# Altium schematic sheet Peripherals.SchDoc
size A4; SheetNumber: 5; SheetTotal: 7
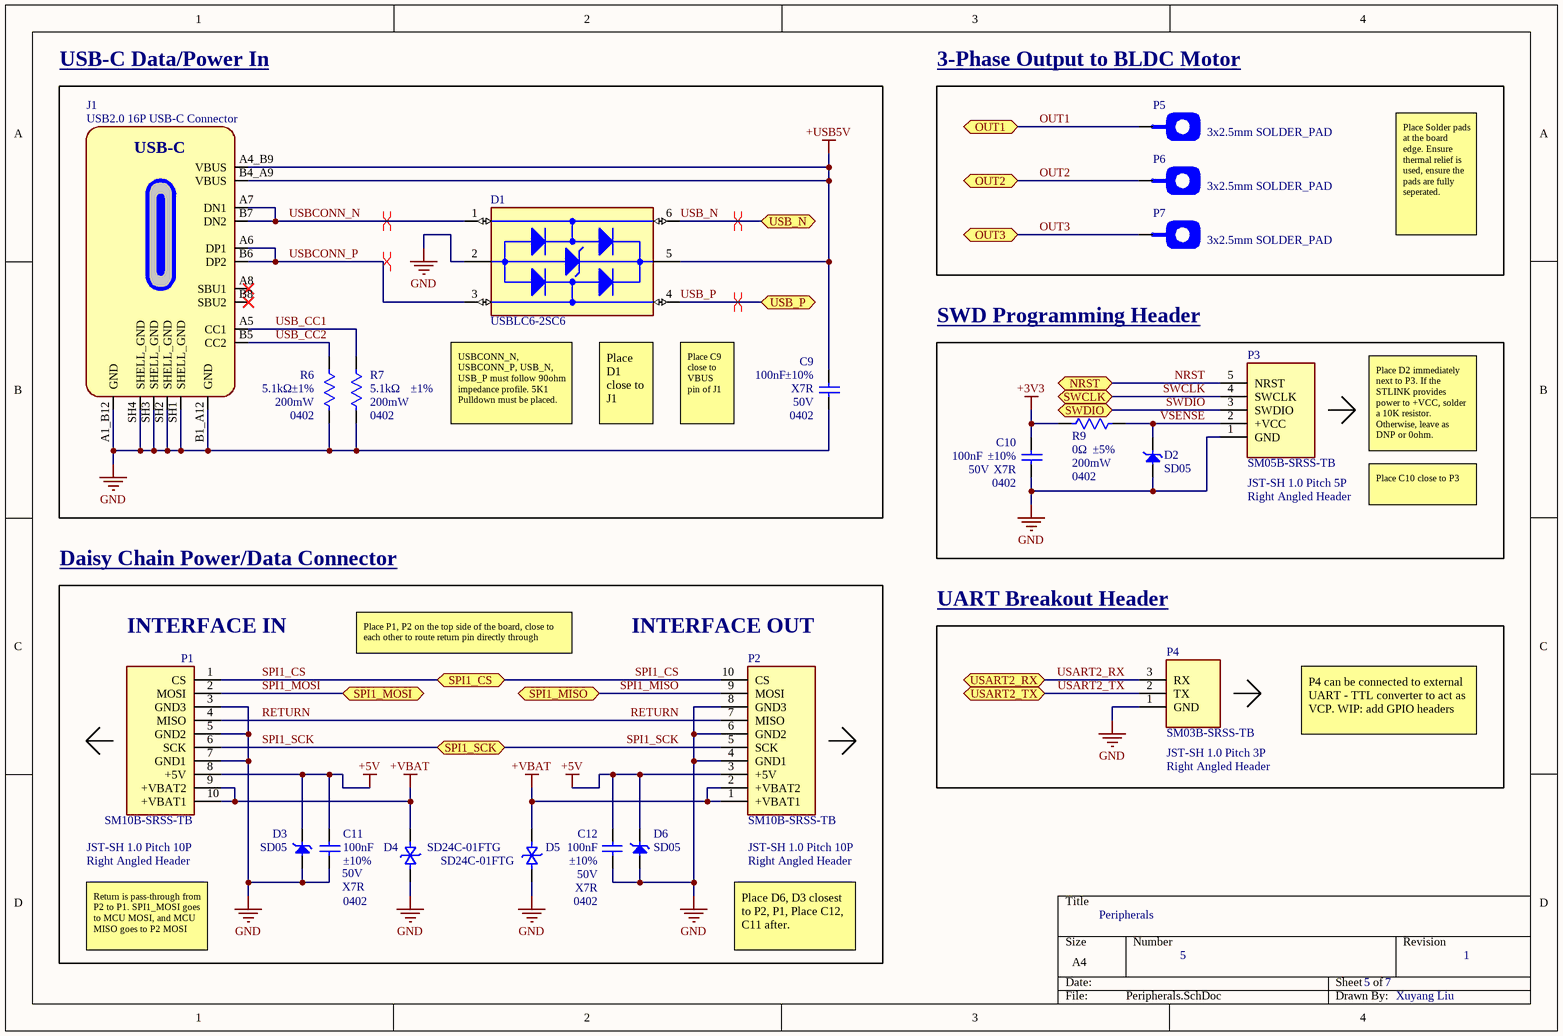
[diagram p0: Peripherals.SchDoc]

## Parts
C9  Case/Package: 0402  Voltage Rating: 50V  Dielectric: X7R  Tolerance: ±10%  [0402_Cap]  (hidden comment: 100nF)
C10  Case/Package: 0402  Voltage Rating: 50V  Dielectric: X7R  Tolerance: ±10%  [0402_Cap]  (hidden comment: 100nF)
C11  Case/Package: 0402  Voltage Rating: 50V  Dielectric: X7R  Tolerance: ±10%  [0402_Cap]  (hidden comment: 100nF)
C12  Case/Package: 0402  Voltage Rating: 50V  Dielectric: X7R  Tolerance: ±10%  [0402_Cap]  (hidden comment: 100nF)
D1  USBLC6-2SC6  [SOT95P280X145-6N]
D2  SD05  [DIO_MM3Z3V0T1G]
D3  SD05  [DIO_MM3Z3V0T1G]
D4  SD24C-01FTG  [FP-SD-C-MFG]
D5  SD24C-01FTG  [FP-SD-C-MFG]
D6  SD05  [DIO_MM3Z3V0T1G]
J1  USB2.0 16P USB-C Connector  [USBC_GCT_USB4105-GF-A-060]
P1  SM10B-SRSS-TB  [SM10B-SRSS-TB]
P2  SM10B-SRSS-TB  [SM10B-SRSS-TB]
P3  SM05B-SRSS-TB  [SM05B-SRSS-TB]
P4  SM03B-SRSS-TB  [SM03B-SRSS-TB]
P5  3x2.5mm SOLDER_PAD  [SOLDER_PAD]
P6  3x2.5mm SOLDER_PAD  [SOLDER_PAD]
P7  3x2.5mm SOLDER_PAD  [SOLDER_PAD]
R6  Tolerance: ±1%  Power Rating: 200mW  Case/Package: 0402  Resistance: 5.1kΩ  [0402_RES]  (hidden comment: 5K1)
R7  Tolerance: ±1%  Power Rating: 200mW  Case/Package: 0402  Resistance: 5.1kΩ  [0402_RES]  (hidden comment: 5K1)
R9  Tolerance: ±5%  Power Rating: 200mW  Case/Package: 0402  Resistance: 0Ω  [0402_RES]  (hidden comment: 0R)

## Blocks framed on the sheet
USB-C Data/Power In: C9 D1 J1 R6 R7
3-Phase Output to BLDC Motor: P5-P7
SWD Programming Header: C10 D2 P3 R9
UART Breakout Header: P4

## Ports
NRST (bidir), OUT1 (bidir), OUT2 (bidir), OUT3 (bidir), SPI1_CS (bidir), SPI1_MISO (bidir), SPI1_MOSI (bidir), SPI1_SCK (bidir), SWCLK (bidir), SWDIO (bidir), USART2_RX (bidir), USART2_TX (bidir), USB_N (bidir), USB_P (bidir)

## Nets
+3V3: C10.2 R9.1
+5V: C11.2 C12.1 D3.K D6.K P1.8(+5V) P2.3(+5V)
+USB5V: C9.2 D1.5(VBUS) J1.A4_B9(VBUS) J1.B4_A9(VBUS)
+VBAT: D4.2 D5.2 P1.9(+VBAT2) P1.10(+VBAT1) P2.1(+VBAT1) P2.2(+VBAT2)
GND: C9.1 C10.1 C11.1 C12.2 D1.2(GND) D2.A D3.A D4.1 D5.1 D6.A J1.A1_B12(GND) J1.B1_A12(GND) J1.SH1(SHELL_GND) J1.SH2(SHELL_GND) J1.SH3(SHELL_GND) J1.SH4(SHELL_GND) P1.3(GND3) P1.5(GND2) P1.7(GND1) P2.4(GND1) P2.6(GND2) P2.8(GND3) P3.1(GND) P4.1(GND) R6.2 R7.1
NRST: P3.5(NRST) ; port NRST
OUT1: P5.1 ; port OUT1
OUT2: P6.1 ; port OUT2
OUT3: P7.1 ; port OUT3
RETURN: P1.4(MISO) P2.7(MISO)
SPI1_CS: P1.1(CS) P2.10(CS) ; port SPI1_CS
SPI1_MISO: P2.9(MOSI) ; port SPI1_MISO
SPI1_MOSI: P1.2(MOSI) ; port SPI1_MOSI
SPI1_SCK: P1.6(SCK) P2.5(SCK) ; port SPI1_SCK
SWCLK: P3.4(SWCLK) ; port SWCLK
SWDIO: P3.3(SWDIO) ; port SWDIO
USART2_RX: P4.3(RX) ; port USART2_RX
USART2_TX: P4.2(TX) ; port USART2_TX
USB_CC1: J1.A5(CC1) R7.2
USB_CC2: J1.B5(CC2) R6.1
USB_N: D1.6(I/O1_OUT) ; port USB_N
USB_P: D1.4(I/O2_OUT) ; port USB_P
USBCONN_N: D1.1(I/O1_IN) J1.A7(DN1) J1.B7(DN2)
USBCONN_P: D1.3(I/O2_IN) J1.A6(DP1) J1.B6(DP2)
VSENSE: D2.K P3.2(+VCC) R9.2

Not connected (* = marked no-connect by the designer): J1 A8(SBU1)* B8(SBU2)*

## Layout directives
differential pair; differential pair class USBCONN_DIFF: USB_N, USB_P, USBCONN_N, USBCONN_P

## Notes on the sheet
- Place Solder pads at the board edge. Ensure thermal relief is used, ensure the pads are fully seperated.
- (near D1) USBCONN_N, USBCONN_P, USB_N, USB_P must follow 90ohm impedance profile. 5K1 Pulldown must be placed.
- (near D1) Place D1 close to J1
- (near D1) Place C9 close to VBUS pin of J1
- Place D2 immediately next to P3. If the STLINK provides power to +VCC, solder a 10K resistor. Otherwise, leave as DNP or 0ohm.
- (near P3) JST-SH 1.0 Pitch 5P
- Right Angled Header
- Place C10 close to P3
- Daisy Chain Power/Data Connector
- (near P1) INTERFACE IN
- Place P1, P2 on the top side of the board, close to each other to route return pin directly through
- (near P2) INTERFACE OUT
- (near P4) JST-SH 1.0 Pitch 3P
- P4 can be connected to external UART - TTL converter to act as VCP. WIP: add GPIO headers
- (near P1) JST-SH 1.0 Pitch 10P
- (near P2) JST-SH 1.0 Pitch 10P
- Peripherals
- Return is pass-through from P2 to P1. SPI1_MOSI goes to MCU MOSI, and MCU MISO goes to P2 MOSI
- Place D6, D3 closest to P2, P1, Place C12, C11 after.
- 5
- 5     7
- 1
- Xuyang Liu
- (in symbol USB4105-GF-A-060) USB-C

## Library data of the parts
C9-C12 = GCM155R71H104KE02J: 50V 100nF X7R ±10% 0402 Multilayer Ceramic Capacitors MLCC - SMD/SMT ROHS; Manufacturer: Murata; Manufacturer Lifecycle Status: IN PRODUCTION; Supplier 1: DigiKey; Manufacturer Part Number: GCM155R71H104KE02J; RoHS: Compliant; Category: Ceramic Capacitors; Stock 1: 13930662; Pricing 1: 1=0.1, 10=0.034, 50=0.0226, 100=0.0193, 500=0.01374, 1000=0.01205, 2500=0.01027, 5000=0.0092 (USD); Case Code (Imperial): 0402; Case Code (Metric): 1005; Country of Origin: Philippines; Dielectric Material: Ceramic; Export Control Classification Number (ECCN) Code: EAR99; Height: 500µm; Harmonized Tariff Schedule (HTS) Code: 8532.24.00.20; Introduction Date: 2013-11-20; Length: 1mm; Lifecycle Status: Production; Material: Ceramic; Max Operating Temperature: 125°C; Min Operating Temperature: -55°C; Mount: Surface Mount; Number of Terminals: 2; Packaging: Tape & Reel (TR); Ratings: AEC-Q200; REACH SVHC: Yes; Schedule B: 8532240020, 8532240020|8532240020, 8532240020|8532240020|8532240020, 8532240020|8532240020|8532240020|8532240020; Termination: SMD/SMT; Voltage Rating (DC): 50V; Weight: 6.010099mg; Width: 500µm; ComponentLink1URL: https://datasheet.octopart.com:443/GCM155R71H104KE02J-Murata-datasheet-155345015.pdf?src-supplier=Newark; ComponentLink1Description: https://datasheet.octopart.com:443/GCM155R71H104KE02J-Murata-datasheet-155345015.pdf?src-supplier=Newark; ComponentLink2URL: https://datasheet.octopart.com:443/GCM155R71H104KE02J-Murata-datasheet-178519985.pdf?src-supplier=Arrow.cn; ComponentLink2Description: https://datasheet.octopart.com:443/GCM155R71H104KE02J-Murata-datasheet-178519985.pdf?src-supplier=Arrow.cn; ComponentLink3URL: https://datasheet.octopart.com:443/GCM155R71H104KE02J-Murata-datasheet-141266224.pdf?src-supplier=Ciiva; ComponentLink3Description: https://datasheet.octopart.com:443/GCM155R71H104KE02J-Murata-datasheet-141266224.pdf?src-supplier=Ciiva; ComponentLink4URL: https://datasheet.octopart.com:443/GCM155R71H104KE02J-Murata-datasheet-140656751.pdf?src-supplier=Ciiva; ComponentLink4Description: https://datasheet.octopart.com:443/GCM155R71H104KE02J-Murata-datasheet-140656751.pdf?src-supplier=Ciiva; ComponentLink5URL: https://datasheet.octopart.com:443/GCM155R71H104KE02J-Murata-datasheet-138716456.pdf?src-supplier=Ciiva; ComponentLink5Description: https://datasheet.octopart.com:443/GCM155R71H104KE02J-Murata-datasheet-138716456.pdf?src-supplier=Ciiva; ComponentLink6URL: https://datasheet.octopart.com:443/GCM155R71H104KE02J-Murata-datasheet-77992203.pdf?src-supplier=Future+Electronics; ComponentLink6Description: https://datasheet.octopart.com:443/GCM155R71H104KE02J-Murata-datasheet-77992203.pdf?src-supplier=Future+Electronics; ComponentLink7URL: https://datasheet.octopart.com:443/GCM155R71H104KE02J-Murata-datasheet-12511495.pdf?src-supplier=TME; ComponentLink7Description: https://datasheet.octopart.com:443/GCM155R71H104KE02J-Murata-datasheet-12511495.pdf?src-supplier=TME; ComponentLink8URL: http://sigma.octopart.com:80/reach_statement/Murata-company-16.pdf?src-supplier=Compliance+Statements; ComponentLink8Description: http://sigma.octopart.com:80/reach_statement/Murata-company-16.pdf?src-supplier=Compliance+Statements; Supplier Part Number 1: 490-14514-6-ND; Capacitance: 100nF
D1 = USBLC6-2SC6: STMicroelectronics USBLC6-2SC6 TVS diode surge protection on full tape reel; Breakdown Voltage: 6V; Capacitance: 2.5pF; Clamping Voltage: 17V; Data Rate: 480Mbps; Direction: Unidirectional; Element Configuration: Dual; ESD Protection: Yes; Forward Voltage: 1.1V; Leakage Current: 150nA; Max Junction Temperature (Tj): 125°C; Max Repetitive Reverse Voltage (Vrrm): 5.25V; Number of Bidirectional Channels: 2; Number of Elements: 1; Peak Pulse Current: 5A; Reverse Standoff Voltage: 5V; Test Current: 1mA; Supplier 1: DigiKey; Manufacturer: STMicroelectronics; Manufacturer Part Number: USBLC6-2SC6; RoHS: Compliant; Category: TVS Diodes; Stock 1: 66064; Pricing 1: 1=0.36, 10=0.243, 100=0.163, 500=0.127, 1000=0.114 (USD); Case/Package: SOT-23; China RoHS: Compliant; Contact Plating: Tin; Depth: 1.75mm; Height: 1.45mm; Lead Free: Lead Free; Length: 3.05mm; Lifecycle Status: Production; Max Breakdown Voltage: 6V; Max Operating Temperature: 125°C; Max Reverse Leakage Current: 150nA; Min Breakdown Voltage: 6V; Min Operating Temperature: -40°C; Mount: Surface Mount; Number of Channels: 2; Number of Pins: 6; Number of Terminals: 6; Operating Supply Voltage: 1.1V; Peak Reverse Current: 150nA; Polarity: Unidirectional; Power Line Protection: Yes; Radiation Hardening: No; REACH SVHC: Yes; Reverse Breakdown Voltage: 6V; Schedule B: 8536300000, 8536300000|8536300000|8536300000|8536300000|8536300000|8536300000|8536300000|8536300000|8536300000|8536300000|8536300000|8536300000|8536300000|8536300000|8536300000|8536300000|8536300000|8536300000|8536300000|8536300000|8536300000|8536300000|8536300000|85; Termination: SMD/SMT; Width: 1.75mm; Working Voltage: 5V; ComponentLink1URL: https://datasheet.octopart.com:443/USBLC6-2SC6-STMicroelectronics-datasheet-10412581.pdf?src-supplier=Newark; ComponentLink1Description: https://datasheet.octopart.com:443/USBLC6-2SC6-STMicroelectronics-datasheet-10412581.pdf?src-supplier=Newark; ComponentLink2URL: https://datasheet.octopart.com:443/USBLC6-2SC6-STMicroelectronics-datasheet-181961833.pdf?src-supplier=Newark; ComponentLink2Description: https://datasheet.octopart.com:443/USBLC6-2SC6-STMicroelectronics-datasheet-181961833.pdf?src-supplier=Newark; ComponentLink3URL: https://datasheet.octopart.com:443/USBLC6-2SC6-STMicroelectronics-datasheet-525477.pdf?src-supplier=Factory+Futures; ComponentLink3Description: https://datasheet.octopart.com:443/USBLC6-2SC6-STMicroelectronics-datasheet-525477.pdf?src-supplier=Factory+Futures; ComponentLink4URL: https://datasheet.octopart.com:443/USBLC6-2SC6-STMicroelectronics-datasheet-82998616.pdf?src-supplier=Farnell; ComponentLink4Description: https://datasheet.octopart.com:443/USBLC6-2SC6-STMicroelectronics-datasheet-82998616.pdf?src-supplier=Farnell; ComponentLink5URL: https://datasheet.octopart.com:443/USBLC6-2SC6-STMicroelectronics-datasheet-46285.pdf?src-supplier=Farnell; ComponentLink5Description: https://datasheet.octopart.com:443/USBLC6-2SC6-STMicroelectronics-datasheet-46285.pdf?src-supplier=Farnell; ComponentLink6URL: https://datasheet.octopart.com:443/USBLC6-2SC6-STMicroelectronics-datasheet-14050643.pdf?src-supplier=iiiC; ComponentLink6Description: https://datasheet.octopart.com:443/USBLC6-2SC6-STMicroelectronics-datasheet-14050643.pdf?src-supplier=iiiC; ComponentLink7URL: https://datasheet.octopart.com:443/USBLC6-2SC6-STMicroelectronics-datasheet-10521292.pdf?src-supplier=Jameco; ComponentLink7Description: https://datasheet.octopart.com:443/USBLC6-2SC6-STMicroelectronics-datasheet-10521292.pdf?src-supplier=Jameco
D2 D3 D6 = SD05: Trans Voltage Suppressor Diode, 350W, 5V V(RWM), Unidirectional, 1 Element, Silicon; Manufacturer: Sangdest Microelectronics; Clamping Voltage: 14.5V; Min Breakdown Voltage: 6V; Number of Elements: 1; Peak Reverse Current: 10µA; Supplier 1: DigiKey; Manufacturer Part Number: SD05; RoHS: Compliant; Category: TVS Diodes; Stock 1: 13210; Pricing 1: 1=0.27, 10=0.165, 100=0.1025, 500=0.0752, 1000=0.06636 (USD); Lifecycle Status: Production; Max Operating Temperature: 125°C; Min Operating Temperature: -55°C; Number of Terminals: 2; Peak Pulse Power: 350W; Polarity: Unidirectional; REACH SVHC: Yes; Reverse Standoff Voltage: 5V; ComponentLink1URL: https://datasheet.octopart.com:443/SD05-SMC-Diode-Solutions-datasheet-181400473.pdf?src-supplier=IHS; ComponentLink1Description: https://datasheet.octopart.com:443/SD05-SMC-Diode-Solutions-datasheet-181400473.pdf?src-supplier=IHS; Supplier Part Number 1: 1655-SD05CT-ND
D4 D5 = SD24C-01FTG: SD Series 42 V 7 A 450 W Surface Mount Bidirectional TVS Diode - SOD-323; Manufacturer: Littelfuse; Breakdown Voltage: 26.7V; Capacitance: 50pF; Clamping Voltage: 42V; Element Configuration: Single; Leakage Current: 1µA; Max Power Dissipation: 450W; Max Surge Current: 7A; Number of Bidirectional Channels: 1; Operating Supply Voltage: 24V; Power Line Protection: No; Supplier 1: DigiKey; Manufacturer Part Number: SD24C-01FTG; RoHS: Compliant; Category: TVS Diodes; Stock 1: 22762; Pricing 1: 1=0.66, 10=0.407, 100=0.2598, 500=0.19638, 1000=0.17589 (USD); Case/Package: SOD; Composition: Zener; Depth: 1.4mm; Direction: Bidirectional; Height: 1.14mm; Lead Free: Lead Free; Length: 1.8mm; Lifecycle Status: Production; Max Operating Temperature: 125°C; Min Breakdown Voltage: 26.7V; Min Operating Temperature: -40°C; Mount: Surface Mount; Number of Channels: 1; Number of Elements: 1; Number of Pins: 2; Number of Terminals: 2; Peak Pulse Current: 7A; Peak Pulse Power: 450W; Polarity: Bidirectional; Radiation Hardening: No; Ratings: AEC-Q101; REACH SVHC: Yes; Reverse Standoff Voltage: 24V; Schedule B: 8536300000, 8536300000|8536300000|8536300000|8536300000|8536300000; Termination: SMD/SMT; Working Voltage: 24V; ComponentLink1URL: https://datasheet.octopart.com:443/SD24C-01FTG-Littelfuse-datasheet-168252985.pdf?src-supplier=Newark; ComponentLink1Description: https://datasheet.octopart.com:443/SD24C-01FTG-Littelfuse-datasheet-168252985.pdf?src-supplier=Newark; ComponentLink2URL: https://datasheet.octopart.com:443/SD24C-01FTG-Littelfuse-datasheet-32866225.pdf?src-supplier=Newark; ComponentLink2Description: https://datasheet.octopart.com:443/SD24C-01FTG-Littelfuse-datasheet-32866225.pdf?src-supplier=Newark; ComponentLink3URL: https://datasheet.octopart.com:443/SD24C-01FTG-Littelfuse-datasheet-138797050.pdf?src-supplier=ODG+(Origin+Data+Global); ComponentLink3Description: https://datasheet.octopart.com:443/SD24C-01FTG-Littelfuse-datasheet-138797050.pdf?src-supplier=ODG+(Origin+Data+Global); ComponentLink4URL: https://datasheet.octopart.com:443/SD24C-01FTG-Littelfuse-datasheet-78834560.pdf?src-supplier=Farnell; ComponentLink4Description: https://datasheet.octopart.com:443/SD24C-01FTG-Littelfuse-datasheet-78834560.pdf?src-supplier=Farnell; ComponentLink5URL: https://datasheet.octopart.com:443/SD24C-01FTG-Littelfuse-datasheet-42901060.pdf?src-supplier=Fuses+Unlimited; ComponentLink5Description: https://datasheet.octopart.com:443/SD24C-01FTG-Littelfuse-datasheet-42901060.pdf?src-supplier=Fuses+Unlimited; ComponentLink6URL: https://datasheet.octopart.com:443/SD24C-01FTG-Littelfuse-datasheet-173466928.pdf?src-supplier=Future+Electronics; ComponentLink6Description: https://datasheet.octopart.com:443/SD24C-01FTG-Littelfuse-datasheet-173466928.pdf?src-supplier=Future+Electronics; ComponentLink7URL: https://datasheet.octopart.com:443/SD24C-01FTG-Littelfuse-datasheet-137408339.pdf?src-supplier=RS+(Formerly+Allied+Electronics); ComponentLink7Description: https://datasheet.octopart.com:443/SD24C-01FTG-Littelfuse-datasheet-137408339.pdf?src-supplier=RS+(Formerly+Allied+Electronics); Supplier Part Number 1: F6446CT-ND
J1 = USB4105-GF-A-060: USB-C (USB TYPE-C) USB 2.0 Receptacle Connector 24 (16+8 Dummy) Position Surface Mount, Right Angle; Through Hole; MF: Global Connector Technology; MP: USB4105GFA060; SnapEDA_Link: https://www.snapeda.com/parts/USB4105GFA060/Global+Connector+Technology/view-part/?ref=snap; Package: None; Value: *; Check_prices: https://www.snapeda.com/parts/USB4105GFA060/Global+Connector+Technology/view-part/?ref=eda
P1 = SM10B-SRSS-TB_1: Board Connector, 10 Contact(s), 1 Row(s), Male, Right Angle, Surface Mount Terminal; Manufacturer: JST; Connector Type: Male Pin; Number of Contacts: 10; Pitch: 990.6µm; Supplier 1: DigiKey; Manufacturer Part Number: SM10B-SRSS-TB; RoHS: Compliant; Category: Card Edge Connectors; Stock 1: 3469; Pricing 1: 1=0.93, 10=0.788, 100=0.6694, 500=0.59746, 1000=0.56894 (USD); Color: Natural; Contact Plating: Tin; Export Control Classification Number (ECCN) Code: EAR99; Gender: Male; Housing Color: Natural; Housing Material: Nylon; Harmonized Tariff Schedule (HTS) Code: 8536.69.40.40; Introduction Date: 1996-04-01; Lead Free: Contains Lead; Lifecycle Status: Obsolete; Mount: Surface Mount; Number of Pins: 10; Number of Positions: 10; Number of Rows: 1; Orientation: Right Angle; Terminal Pitch: 1mm; Termination: Solder; ComponentLink1URL: https://datasheet.octopart.com:443/SM10B-SRSS-TB-JST-datasheet-180492086.pdf?src-supplier=IHS; ComponentLink1Description: https://datasheet.octopart.com:443/SM10B-SRSS-TB-JST-datasheet-180492086.pdf?src-supplier=IHS; ComponentLink2URL: https://datasheet.octopart.com:443/SM10B-SRSS-TB-JST-datasheet-118603.pdf?src-supplier=DigiKey; ComponentLink2Description: https://datasheet.octopart.com:443/SM10B-SRSS-TB-JST-datasheet-118603.pdf?src-supplier=DigiKey
P2 = SM10B-SRSS-TB_2: Board Connector, 10 Contact(s), 1 Row(s), Male, Right Angle, Surface Mount Terminal; Manufacturer: JST; Connector Type: Male Pin; Number of Contacts: 10; Pitch: 990.6µm; Supplier 1: DigiKey; Manufacturer Part Number: SM10B-SRSS-TB; RoHS: Compliant; Category: Card Edge Connectors; Stock 1: 3469; Pricing 1: 1=0.93, 10=0.788, 100=0.6694, 500=0.59746, 1000=0.56894 (USD); Color: Natural; Contact Plating: Tin; Export Control Classification Number (ECCN) Code: EAR99; Gender: Male; Housing Color: Natural; Housing Material: Nylon; Harmonized Tariff Schedule (HTS) Code: 8536.69.40.40; Introduction Date: 1996-04-01; Lead Free: Contains Lead; Lifecycle Status: Obsolete; Mount: Surface Mount; Number of Pins: 10; Number of Positions: 10; Number of Rows: 1; Orientation: Right Angle; Terminal Pitch: 1mm; Termination: Solder; ComponentLink1URL: https://datasheet.octopart.com:443/SM10B-SRSS-TB-JST-datasheet-180492086.pdf?src-supplier=IHS; ComponentLink1Description: https://datasheet.octopart.com:443/SM10B-SRSS-TB-JST-datasheet-180492086.pdf?src-supplier=IHS; ComponentLink2URL: https://datasheet.octopart.com:443/SM10B-SRSS-TB-JST-datasheet-118603.pdf?src-supplier=DigiKey; ComponentLink2Description: https://datasheet.octopart.com:443/SM10B-SRSS-TB-JST-datasheet-118603.pdf?src-supplier=DigiKey
P3 = SM05B-SRSS-TB-SWD: Board Connector, 5 Contact(s), 1 Row(s), Male, Right Angle, Surface Mount Terminal; Manufacturer: JST; Connector Type: Male Pin; Number of Contacts: 5; Pitch: 990.6µm; Supplier 1: DigiKey; Manufacturer Part Number: SM05B-SRSS-TB; RoHS: Compliant; Category: Card Edge Connectors; Stock 1: 42194; Pricing 1: 1=0.62, 10=0.527, 100=0.4477, 500=0.3996, 1000=0.38051 (USD); Color: Natural; Contact Plating: Tin; Export Control Classification Number (ECCN) Code: EAR99; Gender: Male; Housing Color: Natural; Housing Material: Nylon; Harmonized Tariff Schedule (HTS) Code: 8536.69.40.40; Introduction Date: 1996-04-01; Lead Free: Contains Lead; Lifecycle Status: Obsolete; Mount: Surface Mount; Number of Positions: 5; Number of Rows: 1; Orientation: Right Angle; Terminal Pitch: 1mm; Termination: Solder; ComponentLink1URL: https://datasheet.octopart.com:443/SM05B-SRSS-TB-JST-datasheet-180492086.pdf?src-supplier=IHS; ComponentLink1Description: https://datasheet.octopart.com:443/SM05B-SRSS-TB-JST-datasheet-180492086.pdf?src-supplier=IHS; ComponentLink2URL: https://datasheet.octopart.com:443/SM05B-SRSS-TB-JST-datasheet-118603.pdf?src-supplier=DigiKey; ComponentLink2Description: https://datasheet.octopart.com:443/SM05B-SRSS-TB-JST-datasheet-118603.pdf?src-supplier=DigiKey; ComponentLink3URL: https://datasheet.octopart.com:443/SM05B-SRSS-TB-JST-datasheet-152738602.pdf?src-supplier=Amar+Radio+Corporation; ComponentLink3Description: https://datasheet.octopart.com:443/SM05B-SRSS-TB-JST-datasheet-152738602.pdf?src-supplier=Amar+Radio+Corporation
P4 = SM03B-SRSS-TB_UART: Board Connector, 3 Contact(s), 1 Row(s), Male, Right Angle, Surface Mount Terminal; Manufacturer: JST; Connector Type: Male Pin; Number of Contacts: 3; Pitch: 990.6µm; Supplier 1: DigiKey; Manufacturer Part Number: SM03B-SRSS-TB; RoHS: Compliant; Category: Card Edge Connectors; Stock 1: 14167; Pricing 1: 1=0.44, 10=0.373, 100=0.317, 500=0.2829, 1000=0.26938 (USD); Color: Natural; Contact Gender: Male; Contact Plating: Tin; Housing Color: Natural; Housing Material: Nylon; Lead Free: Contains Lead; Lifecycle Status: Obsolete; Max Operating Temperature: 85°C; Min Operating Temperature: -25°C; Mount: Surface Mount; Number of Pins: 3; Number of Positions: 3; Number of Rows: 1; Orientation: Horizontal; Terminal Pitch: 1mm; Termination: Solder; ComponentLink1URL: https://datasheet.octopart.com:443/SM03B-SRSS-TB-JST-datasheet-180492086.pdf?src-supplier=IHS; ComponentLink1Description: https://datasheet.octopart.com:443/SM03B-SRSS-TB-JST-datasheet-180492086.pdf?src-supplier=IHS; ComponentLink2URL: https://datasheet.octopart.com:443/SM03B-SRSS-TB-JST-datasheet-44103209.pdf?src-supplier=TME; ComponentLink2Description: https://datasheet.octopart.com:443/SM03B-SRSS-TB-JST-datasheet-44103209.pdf?src-supplier=TME; ComponentLink3URL: https://datasheet.octopart.com:443/SM03B-SRSS-TB-JST-datasheet-118603.pdf?src-supplier=DigiKey; ComponentLink3Description: https://datasheet.octopart.com:443/SM03B-SRSS-TB-JST-datasheet-118603.pdf?src-supplier=DigiKey; ComponentLink4URL: https://datasheet.octopart.com:443/SM03B-SRSS-TB-JST-datasheet-152738602.pdf?src-supplier=Amar+Radio+Corporation; ComponentLink4Description: https://datasheet.octopart.com:443/SM03B-SRSS-TB-JST-datasheet-152738602.pdf?src-supplier=Amar+Radio+Corporation
P5-P7 = 3x2.5mm SOLDER_PAD: Plated Through Hole 3x2.5mm SOLDER_PAD
R6 R7 = RCS04025K10FKED: 5.1kΩ SMD Chip Resistor, 5.1 kOhm, ± 1%, 200 mW, 0402 [1005 Metric], Thick Film, Anti-Surge; Manufacturer: Vishay; Temperature Coefficient: 100ppm/°C; Working Voltage: 50V; Supplier 1: DigiKey; Manufacturer Part Number: RCS04025K10FKED; RoHS: Compliant; Category: Chip SMD Resistors; Stock 1: 18413; Pricing 1: 1=0.12, 10=0.058, 25=0.0448, 50=0.0372, 100=0.0313, 250=0.02536, 500=0.02198, 1000=0.01929, 5000=0.01503 (USD); China RoHS: Non-Compliant; Composition: Thick Film; Country of Origin: Israel, Mainland China; Export Control Classification Number (ECCN) Code: EAR99; Features: Automotive AEC-Q200; Height: 350µm; Harmonized Tariff Schedule (HTS) Code: 8533.21.00.30; Introduction Date: 2016-07-12; Length: 1mm; Lifecycle Status: Production; Max Operating Temperature: 155°C; Max Power Dissipation: 200mW; Min Operating Temperature: -55°C; Mount: Surface Mount; Number of Terminals: 2; Number of Terminations: 2; Ratings: AEC-Q200; REACH SVHC: Yes; Width: 500µm; ComponentLink1URL: https://datasheet.octopart.com:443/RCS04025K10FKED-Vishay-datasheet-176436275.pdf?src-supplier=IHS; ComponentLink1Description: https://datasheet.octopart.com:443/RCS04025K10FKED-Vishay-datasheet-176436275.pdf?src-supplier=IHS; ComponentLink2URL: http://sigma.octopart.com:80/rohs_statement/Vishay-company-15.pdf?src-supplier=Compliance+Statements; ComponentLink2Description: http://sigma.octopart.com:80/rohs_statement/Vishay-company-15.pdf?src-supplier=Compliance+Statements; Supplier Part Number 1: 541-RCS04025K10FKEDCT-ND
R9 = RCS04020000Z0ED: 0Ω Resistor, Jumper, 0402 [1005 Metric], Thick Film, 200 mW, 3 A, Surface Mount Device; Manufacturer: Vishay; Max Current Rating: 3A; Voltage Rating: 50V; Supplier 1: DigiKey; Manufacturer Part Number: RCS04020000Z0ED; RoHS: Compliant; Category: Chip SMD Resistors; Stock 1: 775160; Pricing 1: 1=0.1, 10=0.032, 25=0.0268, 50=0.0232, 100=0.0204, 250=0.01728, 500=0.01532, 1000=0.01364, 5000=0.01064 (USD); Case Code (Imperial): 0402; Case Code (Metric): 1005; China RoHS: Non-Compliant; Composition: Thick Film; Country of Origin: Israel, Mainland China; Export Control Classification Number (ECCN) Code: EAR99; Features: Automotive AEC-Q200; Height: 350µm; Harmonized Tariff Schedule (HTS) Code: 8533.21.00.30; Introduction Date: 2016-07-12; Length: 1mm; Lifecycle Status: Production; Max Operating Temperature: 155°C; Max Power Dissipation: 200mW; Min Operating Temperature: -55°C; Mount: Surface Mount; Number of Terminals: 2; Number of Terminations: 2; Ratings: AEC-Q200; REACH SVHC: Yes; Voltage Rating (DC): 50V; Width: 500µm; ComponentLink1URL: https://datasheet.octopart.com:443/RCS04020000Z0ED-Vishay-datasheet-176436275.pdf?src-supplier=IHS; ComponentLink1Description: https://datasheet.octopart.com:443/RCS04020000Z0ED-Vishay-datasheet-176436275.pdf?src-supplier=IHS; ComponentLink2URL: https://datasheet.octopart.com:443/RCS04020000Z0ED-Vishay-datasheet-86813749.pdf?src-supplier=Future+Electronics; ComponentLink2Description: https://datasheet.octopart.com:443/RCS04020000Z0ED-Vishay-datasheet-86813749.pdf?src-supplier=Future+Electronics; ComponentLink3URL: http://sigma.octopart.com:80/rohs_statement/Vishay-company-15.pdf?src-supplier=Compliance+Statements; ComponentLink3Description: http://sigma.octopart.com:80/rohs_statement/Vishay-company-15.pdf?src-supplier=Compliance+Statements; Supplier Part Number 1: 541-2877-6-ND